# Altium project T3-COM1-2.PrjPcb (part 2 of 6)
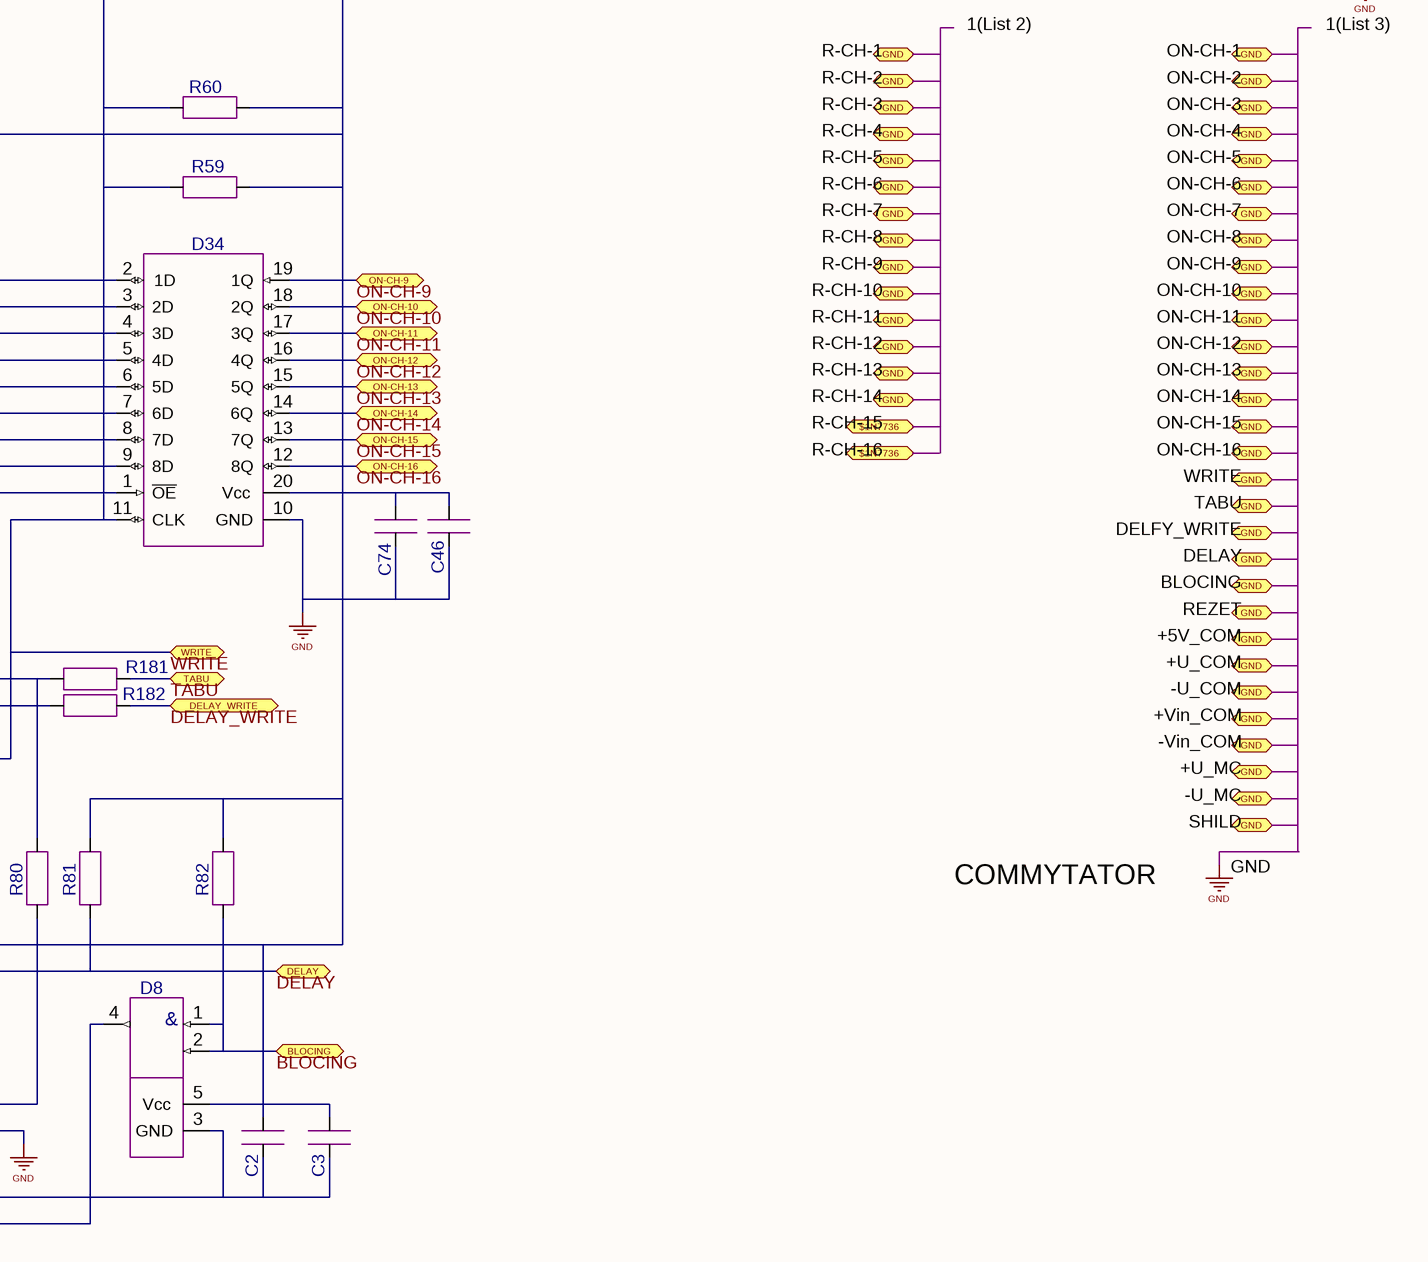
[diagram p16: Schematic1_1.SchDoc, bottom right]

## Sheet Schematic1_1.SchDoc (continued)

### Library data of the parts
C1 = CAP CER 0.1UF 50V 10% X7R 0603: CL10B104KB8SFNC; Part Label: 100nF VIP; Cell Name: 0603-STANDART-1608; CmpIndex: 1222; Ref Designator: C1; Symbol name: C-SXEM-1.1; SymIndex: 6; Part Name: CAP CER 0.1UF 50V 10% X7R 0603; Part Number: CL10B104KB8SFNC
C2 = CAP CER 0.1UF 50V 10% X7R 0603: CL10B104KB8SFNC; Part Label: 100nF VIP; Cell Name: 0603-STANDART-1608; CmpIndex: 1233; Ref Designator: C2; Symbol name: C-SXEM-1.1; SymIndex: 6; Part Name: CAP CER 0.1UF 50V 10% X7R 0603; Part Number: CL10B104KB8SFNC
C3 = CAP CER 0.1UF 50V 10% X7R 0603: CL10B104KB8SFNC; Part Label: 100nF VIP; Cell Name: 0603-STANDART-1608; CmpIndex: 1234; Ref Designator: C3; Symbol name: C-SXEM-1.1; SymIndex: 6; Part Name: CAP CER 0.1UF 50V 10% X7R 0603; Part Number: CL10B104KB8SFNC
C4 = CAP CER 0.1UF 50V 10% X7R 0603: CL10B104KB8SFNC; Part Label: 100nF VIP; Cell Name: 0603-STANDART-1608; CmpIndex: 1235; Ref Designator: C4; Symbol name: C-SXEM-1.1; SymIndex: 6; Part Name: CAP CER 0.1UF 50V 10% X7R 0603; Part Number: CL10B104KB8SFNC
C5 = CAP CER 0.1UF 50V 10% X7R 0603: CL10B104KB8SFNC; Part Label: 100nF VIP; Cell Name: 0603-STANDART-1608; CmpIndex: 1236; Ref Designator: C5; Symbol name: C-SXEM-1.1; SymIndex: 6; Part Name: CAP CER 0.1UF 50V 10% X7R 0603; Part Number: CL10B104KB8SFNC
C6 = CAP CER 0.1UF 50V 10% X7R 0603: CL10B104KB8SFNC; Part Label: 100nF VIP; Cell Name: 0603-STANDART-1608; CmpIndex: 1237; Ref Designator: C6; Symbol name: C-SXEM-1.1; SymIndex: 6; Part Name: CAP CER 0.1UF 50V 10% X7R 0603; Part Number: CL10B104KB8SFNC
C7 = CAP CER 0.1UF 50V 10% X7R 0603: CL10B104KB8SFNC; Part Label: 100nF VIP; Cell Name: 0603-STANDART-1608; CmpIndex: 1238; Ref Designator: C7; Symbol name: C-SXEM-1.1; SymIndex: 6; Part Name: CAP CER 0.1UF 50V 10% X7R 0603; Part Number: CL10B104KB8SFNC
C45 = CAP CER 2.2UF 16V 10% X7R 0805: CL21B225KOFNNNE; Part Label: 2,2u VIP; Cell Name: 0805-STANDART-2012; CmpIndex: 784; Ref Designator: C45; Symbol name: C-SXEM-1.1; SymIndex: 6; Part Name: CAP CER 2.2UF 16V 10% X7R 0805; Part Number: CL21B225KOFNNNE
C46 = CAP CER 2.2UF 16V 10% X7R 0805: CL21B225KOFNNNE; Part Label: 2,2u VIP; Cell Name: 0805-STANDART-2012; CmpIndex: 1175; Ref Designator: C46; Symbol name: C-SXEM-1.1; SymIndex: 6; Part Name: CAP CER 2.2UF 16V 10% X7R 0805; Part Number: CL21B225KOFNNNE
C47 = CAP CER 2.2UF 16V 10% X7R 0805: CL21B225KOFNNNE; Part Label: 2,2u VIP; Cell Name: 0805-STANDART-2012; CmpIndex: 434; Ref Designator: C47; Symbol name: C-SXEM-1.1; SymIndex: 6; Part Name: CAP CER 2.2UF 16V 10% X7R 0805; Part Number: CL21B225KOFNNNE
C48 = CAP CER 2.2UF 16V 10% X7R 0805: CL21B225KOFNNNE; Part Label: 2,2u VIP; Cell Name: 0805-STANDART-2012; CmpIndex: 441; Ref Designator: C48; Symbol name: C-SXEM-1.1; SymIndex: 6; Part Name: CAP CER 2.2UF 16V 10% X7R 0805; Part Number: CL21B225KOFNNNE
C72 = CAP CER 10UF 16V 10% X7R 0805: CL21B106KOQNNNE; Part Label: 10uF VIP; Cell Name: 0805-STANDART-2012; CmpIndex: 1223; Ref Designator: C72; Symbol name: C-SXEM-1.1; SymIndex: 6; Part Name: CAP CER 10UF 16V 10% X7R 0805; Part Number: CL21B106KOQNNNE
C73 = CAP CER 10UF 16V 10% X7R 0805: CL21B106KOQNNNE; Part Label: 10uF VIP; Cell Name: 0805-STANDART-2012; CmpIndex: 356; Ref Designator: C73; Symbol name: C-SXEM-1.1; SymIndex: 6; Part Name: CAP CER 10UF 16V 10% X7R 0805; Part Number: CL21B106KOQNNNE
C74 = CAP CER 10UF 16V 10% X7R 0805: CL21B106KOQNNNE; Part Label: 10uF VIP; Cell Name: 0805-STANDART-2012; CmpIndex: 357; Ref Designator: C74; Symbol name: C-SXEM-1.1; SymIndex: 6; Part Name: CAP CER 10UF 16V 10% X7R 0805; Part Number: CL21B106KOQNNNE
C95 = CAP CER 10UF 25V 10% X7R 1210: GRM32DR71E106KA12L; Cell Name: 1210-STANDART-3225; CmpIndex: 1209; Ref Designator: C95; Symbol name: C-SXEM-1.1; SymIndex: 6; Part Label: 10uF; Part Name: CAP CER 10UF 25V 10% X7R 1210; Part Number: GRM32DR71E106KA12L
C96 = CAP CER 10UF 25V 10% X7R 1210: GRM32DR71E106KA12L; Cell Name: 1210-STANDART-3225; CmpIndex: 1210; Ref Designator: C96; Symbol name: C-SXEM-1.1; SymIndex: 6; Part Label: 10uF; Part Name: CAP CER 10UF 25V 10% X7R 1210; Part Number: GRM32DR71E106KA12L
C97 = CAP CER 10UF 25V 10% X7R 1210: GRM32DR71E106KA12L; Cell Name: 1210-STANDART-3225; CmpIndex: 1211; Ref Designator: C97; Symbol name: C-SXEM-1.1; SymIndex: 6; Part Label: 10uF; Part Name: CAP CER 10UF 25V 10% X7R 1210; Part Number: GRM32DR71E106KA12L
C117 = CAP CER 1000PF 50V 5% NP0 0603: GRM1885C1H102JA01D; Part Label: 1nF; Cell Name: 0603-STANDART-1608; CmpIndex: 649; Ref Designator: C117; Symbol name: C-SXEM-1.1; SymIndex: 6; Part Name: CAP CER 1000PF 50V 5% NP0 0603; Part Number: GRM1885C1H102JA01D
C118 = CAP CER 1000PF 50V 5% NP0 0603: GRM1885C1H102JA01D; Part Label: 1nF; Cell Name: 0603-STANDART-1608; CmpIndex: 661; Ref Designator: C118; Symbol name: C-SXEM-1.1; SymIndex: 6; Part Name: CAP CER 1000PF 50V 5% NP0 0603; Part Number: GRM1885C1H102JA01D
C119 = CAP CER 1000PF 50V 5% NP0 0603: GRM1885C1H102JA01D; Part Label: 1nF; Cell Name: 0603-STANDART-1608; CmpIndex: 664; Ref Designator: C119; Symbol name: C-SXEM-1.1; SymIndex: 6; Part Name: CAP CER 1000PF 50V 5% NP0 0603; Part Number: GRM1885C1H102JA01D
C120 = CAP CER 1000PF 50V 5% NP0 0603: GRM1885C1H102JA01D; Part Label: 1nF; Cell Name: 0603-STANDART-1608; CmpIndex: 666; Ref Designator: C120; Symbol name: C-SXEM-1.1; SymIndex: 6; Part Name: CAP CER 1000PF 50V 5% NP0 0603; Part Number: GRM1885C1H102JA01D
C121 = CAP CER 1000PF 50V 5% NP0 0603: GRM1885C1H102JA01D; Part Label: 1nF; Cell Name: 0603-STANDART-1608; CmpIndex: 670; Ref Designator: C121; Symbol name: C-SXEM-1.1; SymIndex: 6; Part Name: CAP CER 1000PF 50V 5% NP0 0603; Part Number: GRM1885C1H102JA01D
C122 = CAP CER 1000PF 50V 5% NP0 0603: GRM1885C1H102JA01D; Part Label: 1nF; Cell Name: 0603-STANDART-1608; CmpIndex: 682; Ref Designator: C122; Symbol name: C-SXEM-1.1; SymIndex: 6; Part Name: CAP CER 1000PF 50V 5% NP0 0603; Part Number: GRM1885C1H102JA01D
C123 = CAP CER 1000PF 50V 5% NP0 0603: GRM1885C1H102JA01D; Part Label: 1nF; Cell Name: 0603-STANDART-1608; CmpIndex: 684; Ref Designator: C123; Symbol name: C-SXEM-1.1; SymIndex: 6; Part Name: CAP CER 1000PF 50V 5% NP0 0603; Part Number: GRM1885C1H102JA01D
C124 = CAP CER 1000PF 50V 5% NP0 0603: GRM1885C1H102JA01D; Part Label: 1nF; Cell Name: 0603-STANDART-1608; CmpIndex: 685; Ref Designator: C124; Symbol name: C-SXEM-1.1; SymIndex: 6; Part Name: CAP CER 1000PF 50V 5% NP0 0603; Part Number: GRM1885C1H102JA01D
C125 = CAP CER 1000PF 50V 5% NP0 0603: GRM1885C1H102JA01D; Part Label: 1nF; Cell Name: 0603-STANDART-1608; CmpIndex: 688; Ref Designator: C125; Symbol name: C-SXEM-1.1; SymIndex: 6; Part Name: CAP CER 1000PF 50V 5% NP0 0603; Part Number: GRM1885C1H102JA01D
C126 = CAP CER 1000PF 50V 5% NP0 0603: GRM1885C1H102JA01D; Part Label: 1nF; Cell Name: 0603-STANDART-1608; CmpIndex: 694; Ref Designator: C126; Symbol name: C-SXEM-1.1; SymIndex: 6; Part Name: CAP CER 1000PF 50V 5% NP0 0603; Part Number: GRM1885C1H102JA01D
C127 = CAP CER 1000PF 50V 5% NP0 0603: GRM1885C1H102JA01D; Part Label: 1nF; Cell Name: 0603-STANDART-1608; CmpIndex: 695; Ref Designator: C127; Symbol name: C-SXEM-1.1; SymIndex: 6; Part Name: CAP CER 1000PF 50V 5% NP0 0603; Part Number: GRM1885C1H102JA01D
C128 = CAP CER 1000PF 50V 5% NP0 0603: GRM1885C1H102JA01D; Part Label: 1nF; Cell Name: 0603-STANDART-1608; CmpIndex: 696; Ref Designator: C128; Symbol name: C-SXEM-1.1; SymIndex: 6; Part Name: CAP CER 1000PF 50V 5% NP0 0603; Part Number: GRM1885C1H102JA01D
C129 = CAP CER 1000PF 50V 5% NP0 0603: GRM1885C1H102JA01D; Part Label: 1nF; Cell Name: 0603-STANDART-1608; CmpIndex: 698; Ref Designator: C129; Symbol name: C-SXEM-1.1; SymIndex: 6; Part Name: CAP CER 1000PF 50V 5% NP0 0603; Part Number: GRM1885C1H102JA01D
C130 = CAP CER 1000PF 50V 5% NP0 0603: GRM1885C1H102JA01D; Part Label: 1nF; Cell Name: 0603-STANDART-1608; CmpIndex: 704; Ref Designator: C130; Symbol name: C-SXEM-1.1; SymIndex: 6; Part Name: CAP CER 1000PF 50V 5% NP0 0603; Part Number: GRM1885C1H102JA01D
C131 = CAP CER 1000PF 50V 5% NP0 0603: GRM1885C1H102JA01D; Part Label: 1nF; Cell Name: 0603-STANDART-1608; CmpIndex: 705; Ref Designator: C131; Symbol name: C-SXEM-1.1; SymIndex: 6; Part Name: CAP CER 1000PF 50V 5% NP0 0603; Part Number: GRM1885C1H102JA01D
C132 = CAP CER 1000PF 50V 5% NP0 0603: GRM1885C1H102JA01D; Part Label: 1nF; Cell Name: 0603-STANDART-1608; CmpIndex: 706; Ref Designator: C132; Symbol name: C-SXEM-1.1; SymIndex: 6; Part Name: CAP CER 1000PF 50V 5% NP0 0603; Part Number: GRM1885C1H102JA01D
C133 = CAP CER 1000PF 50V 5% NP0 0603: GRM1885C1H102JA01D; Part Label: 1nF; Cell Name: 0603-STANDART-1608; CmpIndex: 707; Ref Designator: C133; Symbol name: C-SXEM-1.1; SymIndex: 6; Part Name: CAP CER 1000PF 50V 5% NP0 0603; Part Number: GRM1885C1H102JA01D
C134 = CAP CER 1000PF 50V 5% NP0 0603: GRM1885C1H102JA01D; Part Label: 1nF; Cell Name: 0603-STANDART-1608; CmpIndex: 716; Ref Designator: C134; Symbol name: C-SXEM-1.1; SymIndex: 6; Part Name: CAP CER 1000PF 50V 5% NP0 0603; Part Number: GRM1885C1H102JA01D
D7 = IC GATE AND 1CH 2-INP SOT-23-5: SN74LVC1G08DBVR; Part Label: 5V/32mA; Cell Name: SOT-23-DBV-R-PDSO-G5-TI; CmpIndex: 1214; Ref Designator: D7; Symbol name: 1IN_AND_GATE.1; SymIndex: 60; Part Name: IC GATE AND 1CH 2-INP SOT-23-5; Part Number: SN74LVC1G08DBVR
D8 = IC GATE AND 1CH 2-INP SOT-23-5: SN74LVC1G08DBVR; Part Label: 5V/32mA; Cell Name: SOT-23-DBV-R-PDSO-G5-TI; CmpIndex: 1227; Ref Designator: D8; Symbol name: 1IN_AND_GATE.1; SymIndex: 60; Part Name: IC GATE AND 1CH 2-INP SOT-23-5; Part Number: SN74LVC1G08DBVR
D18 = OPTOISO 2.5KV 2CH TRANS 8SOIC: MOCD207R2M; Part Label: 2K; Cell Name: 8-SOIC-VISHAY; CmpIndex: 407; Ref Designator: D18; Symbol name: PS2501L-2.1; SymIndex: 24; Part Name: OPTOISO 2.5KV 2CH TRANS 8SOIC; Part Number: MOCD207R2M
D25 = IC DARL TRANS ARRAY 16-SOIC: ULN2003ADR; Part Label: 7K; Cell Name: D_R_PDSO-G16; CmpIndex: 406; Ref Designator: D25; Symbol name: ULN2003.1; SymIndex: 23; Part Name: IC DARL TRANS ARRAY 16-SOIC; Part Number: ULN2003ADR
D26 = IC DARL TRANS ARRAY 16-SOIC: ULN2003ADR; Part Label: 7K; Cell Name: D_R_PDSO-G16; CmpIndex: 622; Ref Designator: D26; Symbol name: ULN2003.1; SymIndex: 23; Part Name: IC DARL TRANS ARRAY 16-SOIC; Part Number: ULN2003ADR
D27 = IC DARL TRANS ARRAY 16-SOIC: ULN2003ADR; Part Label: 7K; Cell Name: D_R_PDSO-G16; CmpIndex: 636; Ref Designator: D27; Symbol name: ULN2003.1; SymIndex: 23; Part Name: IC DARL TRANS ARRAY 16-SOIC; Part Number: ULN2003ADR
D29 = OPTOISO 3KV 4CH TRANS 16SOIC: ACPL-247-500E; Part Label: 4K; Cell Name: 16-SOIC-VISHAY; CmpIndex: 648; Ref Designator: D29; Symbol name: PS2501L-4.1; SymIndex: 26; Part Name: OPTOISO 3KV 4CH TRANS 16SOIC; Part Number: ACPL-247-500E
D30 = OPTOISO 3KV 4CH TRANS 16SOIC: ACPL-247-500E; Part Label: 4K; Cell Name: 16-SOIC-VISHAY; CmpIndex: 667; Ref Designator: D30; Symbol name: PS2501L-4.1; SymIndex: 26; Part Name: OPTOISO 3KV 4CH TRANS 16SOIC; Part Number: ACPL-247-500E
D31 = OPTOISO 3KV 4CH TRANS 16SOIC: ACPL-247-500E; Part Label: 4K; Cell Name: 16-SOIC-VISHAY; CmpIndex: 687; Ref Designator: D31; Symbol name: PS2501L-4.1; SymIndex: 26; Part Name: OPTOISO 3KV 4CH TRANS 16SOIC; Part Number: ACPL-247-500E
D32 = OPTOISO 3KV 4CH TRANS 16SOIC: ACPL-247-500E; Part Label: 4K; Cell Name: 16-SOIC-VISHAY; CmpIndex: 697; Ref Designator: D32; Symbol name: PS2501L-4.1; SymIndex: 26; Part Name: OPTOISO 3KV 4CH TRANS 16SOIC; Part Number: ACPL-247-500E
D33 = IC D-TYPE POS TRG SNGL 20TSSOP: SN74AHC574PWR; Part Label: 4,4mm_NON-INV; Cell Name: PW-R-PDSO-G20-TI; CmpIndex: 774; Ref Designator: D33; Symbol name: SN74LVC574.1; SymIndex: 32; Part Name: IC D-TYPE POS TRG SNGL 20TSSOP; Part Number: SN74AHC574PWR
D34 = IC D-TYPE POS TRG SNGL 20TSSOP: SN74AHC574PWR; Part Label: 4,4mm_NON-INV; Cell Name: PW-R-PDSO-G20-TI; CmpIndex: 1070; Ref Designator: D34; Symbol name: SN74LVC574.1; SymIndex: 32; Part Name: IC D-TYPE POS TRG SNGL 20TSSOP; Part Number: SN74AHC574PWR
D40 = IC BUS TRANSCEIVER DUAL 20TSSOP: SN74ABT640PWR; Part Label: INV; Cell Name: PW-R-PDSO-G20; CmpIndex: 1277; Ref Designator: D40; Symbol name: SN74HCT245.1; SymIndex: 29; Part Name: IC BUS TRANSCEIVER DUAL 20TSSOP; Part Number: SN74ABT640PWR
D41 = IC BUS TRANSCEIVER DUAL 20TSSOP: SN74ABT640PWR; Part Label: INV; Cell Name: PW-R-PDSO-G20; CmpIndex: 1278; Ref Designator: D41; Symbol name: SN74HCT245.1; SymIndex: 29; Part Name: IC BUS TRANSCEIVER DUAL 20TSSOP; Part Number: SN74ABT640PWR
D42 = IC GATE NOR 1CH 3-INP SOT-23-6: SN74LVC1G27DBVR; Cell Name: DBV_R-PDSO-G6; CmpIndex: 1286; Ref Designator: D42; Symbol name: 3IN_NOR_GATE.1; SymIndex: 70; Part Name: IC GATE NOR 1CH 3-INP SOT-23-6; Part Number: SN74LVC1G27DBVR
D43 = IC ISOLATOR 2CH 3.75KV 8SOIC: SI8620EC-B-IS; Part Label: 2K; Cell Name: SOIC-8-SIL-LAB-NB; CmpIndex: 1338; Ref Designator: D43; Symbol name: SI8620.1; SymIndex: 73; Part Name: IC ISOLATOR 2CH 3.75KV 8SOIC; Part Number: SI8620EC-B-IS
FB1 = FERRITE BEAD 1000 OHM 0,4 A 0603: MMZ1608S102A; Part Label: 1K/0,4A; Cell Name: 0603-STANDART-1608; CmpIndex: 1276; Ref Designator: FB1; Symbol name: FERRITE-1.1; SymIndex: 10; Part Name: FERRITE BEAD 1000 OHM 0,4 A 0603; Part Number: MMZ1608S102A
FB8 = FERRITE BEAD 1800 OHM 0,2 A 0603: MMZ1608A182B; Part Label: 1,8K/0,2A; Cell Name: 0603-STANDART-1608; CmpIndex: 785; Ref Designator: FB8; Symbol name: FERRITE-1.1; SymIndex: 10; Part Name: FERRITE BEAD 1800 OHM 0,2 A 0603; Part Number: MMZ1608A182B
FB9 = FERRITE BEAD 1800 OHM 0,2 A 0603: MMZ1608A182B; Part Label: 1,8K/0,2A; Cell Name: 0603-STANDART-1608; CmpIndex: 1225; Ref Designator: FB9; Symbol name: FERRITE-1.1; SymIndex: 10; Part Name: FERRITE BEAD 1800 OHM 0,2 A 0603; Part Number: MMZ1608A182B
J1 = CONN JUMPER SHORTING .100" GOLD: SPC02SVJN-RC-3POS; Part Label: 2 POS; Cell Name: PLS-3-2,54; CmpIndex: 775; Ref Designator: J1; Symbol name: JUMPER-3.1; SymIndex: 33; Part Name: CONN JUMPER SHORTING .100" GOLD; Part Number: SPC02SVJN-RC-3POS
J2 = CONN JUMPER SHORTING .100" GOLD: SPC02SVJN-RC-3POS; Part Label: 2 POS; Cell Name: PLS-3-2,54; CmpIndex: 776; Ref Designator: J2; Symbol name: JUMPER-3.1; SymIndex: 33; Part Name: CONN JUMPER SHORTING .100" GOLD; Part Number: SPC02SVJN-RC-3POS
J3 = CONN JUMPER SHORTING .100" GOLD: SPC02SVJN-RC-3POS; Part Label: 2 POS; Cell Name: PLS-3-2,54; CmpIndex: 777; Ref Designator: J3; Symbol name: JUMPER-3.1; SymIndex: 33; Part Name: CONN JUMPER SHORTING .100" GOLD; Part Number: SPC02SVJN-RC-3POS
J4 = CONN JUMPER SHORTING .100" GOLD: SPC02SVJN-RC-3POS; Part Label: 2 POS; Cell Name: PLS-3-2,54; CmpIndex: 778; Ref Designator: J4; Symbol name: JUMPER-3.1; SymIndex: 33; Part Name: CONN JUMPER SHORTING .100" GOLD; Part Number: SPC02SVJN-RC-3POS
J5 = CONN JUMPER SHORTING .100" GOLD: SPC02SVJN-RC-3POS; Part Label: 2 POS; Cell Name: PLS-3-2,54; CmpIndex: 779; Ref Designator: J5; Symbol name: JUMPER-3.1; SymIndex: 33; Part Name: CONN JUMPER SHORTING .100" GOLD; Part Number: SPC02SVJN-RC-3POS
J6 = CONN JUMPER SHORTING .100" GOLD: SPC02SVJN-RC-3POS; Part Label: 2 POS; Cell Name: PLS-3-2,54; CmpIndex: 780; Ref Designator: J6; Symbol name: JUMPER-3.1; SymIndex: 33; Part Name: CONN JUMPER SHORTING .100" GOLD; Part Number: SPC02SVJN-RC-3POS
J7 = CONN JUMPER SHORTING .100" GOLD: SPC02SVJN-RC-3POS; Part Label: 2 POS; Cell Name: PLS-3-2,54; CmpIndex: 781; Ref Designator: J7; Symbol name: JUMPER-3.1; SymIndex: 33; Part Name: CONN JUMPER SHORTING .100" GOLD; Part Number: SPC02SVJN-RC-3POS
J8 = CONN JUMPER SHORTING .100" GOLD: SPC02SVJN-RC-3POS; Part Label: 2 POS; Cell Name: PLS-3-2,54; CmpIndex: 782; Ref Designator: J8; Symbol name: JUMPER-3.1; SymIndex: 33; Part Name: CONN JUMPER SHORTING .100" GOLD; Part Number: SPC02SVJN-RC-3POS
J9 = CONN JUMPER SHORTING .100" GOLD: SPC02SVJN-RC-3POS; Part Label: 2 POS; Cell Name: PLS-3-2,54; CmpIndex: 1071; Ref Designator: J9; Symbol name: JUMPER-3.1; SymIndex: 33; Part Name: CONN JUMPER SHORTING .100" GOLD; Part Number: SPC02SVJN-RC-3POS
J10 = CONN JUMPER SHORTING .100" GOLD: SPC02SVJN-RC-3POS; Part Label: 2 POS; Cell Name: PLS-3-2,54; CmpIndex: 1166; Ref Designator: J10; Symbol name: JUMPER-3.1; SymIndex: 33; Part Name: CONN JUMPER SHORTING .100" GOLD; Part Number: SPC02SVJN-RC-3POS
J11 = CONN JUMPER SHORTING .100" GOLD: SPC02SVJN-RC-3POS; Part Label: 2 POS; Cell Name: PLS-3-2,54; CmpIndex: 1168; Ref Designator: J11; Symbol name: JUMPER-3.1; SymIndex: 33; Part Name: CONN JUMPER SHORTING .100" GOLD; Part Number: SPC02SVJN-RC-3POS
J12 = CONN JUMPER SHORTING .100" GOLD: SPC02SVJN-RC-3POS; Part Label: 2 POS; Cell Name: PLS-3-2,54; CmpIndex: 1169; Ref Designator: J12; Symbol name: JUMPER-3.1; SymIndex: 33; Part Name: CONN JUMPER SHORTING .100" GOLD; Part Number: SPC02SVJN-RC-3POS
J13 = CONN JUMPER SHORTING .100" GOLD: SPC02SVJN-RC-3POS; Part Label: 2 POS; Cell Name: PLS-3-2,54; CmpIndex: 1170; Ref Designator: J13; Symbol name: JUMPER-3.1; SymIndex: 33; Part Name: CONN JUMPER SHORTING .100" GOLD; Part Number: SPC02SVJN-RC-3POS
J14 = CONN JUMPER SHORTING .100" GOLD: SPC02SVJN-RC-3POS; Part Label: 2 POS; Cell Name: PLS-3-2,54; CmpIndex: 1171; Ref Designator: J14; Symbol name: JUMPER-3.1; SymIndex: 33; Part Name: CONN JUMPER SHORTING .100" GOLD; Part Number: SPC02SVJN-RC-3POS
J15 = CONN JUMPER SHORTING .100" GOLD: SPC02SVJN-RC-3POS; Part Label: 2 POS; Cell Name: PLS-3-2,54; CmpIndex: 1172; Ref Designator: J15; Symbol name: JUMPER-3.1; SymIndex: 33; Part Name: CONN JUMPER SHORTING .100" GOLD; Part Number: SPC02SVJN-RC-3POS
J16 = CONN JUMPER SHORTING .100" GOLD: SPC02SVJN-RC-3POS; Part Label: 2 POS; Cell Name: PLS-3-2,54; CmpIndex: 1173; Ref Designator: J16; Symbol name: JUMPER-3.1; SymIndex: 33; Part Name: CONN JUMPER SHORTING .100" GOLD; Part Number: SPC02SVJN-RC-3POS
KW1 = MGSHV-0_12-D1_3xd0.45: CmpIndex: 460; Ref Designator: KW1; Symbol name: KONT-PROVOD.1; SymIndex: 77; Part Name: MGSHV-0_12-D1_3xd0.45; Part Number: MGSHV-0_12-D1_3xd0.45
KW2 = MGSHV-0_12-D1_3xd0.45: CmpIndex: 461; Ref Designator: KW2; Symbol name: KONT-PROVOD.1; SymIndex: 77; Part Name: MGSHV-0_12-D1_3xd0.45; Part Number: MGSHV-0_12-D1_3xd0.45
KW3 = MGSHV-0_12-D1_3xd0.45: CmpIndex: 462; Ref Designator: KW3; Symbol name: KONT-PROVOD.1; SymIndex: 77; Part Name: MGSHV-0_12-D1_3xd0.45; Part Number: MGSHV-0_12-D1_3xd0.45
R41 = RES 4.70K OHM 1/10W 1% 0603 SMD: ERJ-3EKF4701V; Part Label: 4,7K; Cell Name: 0603-STANDART-1608; CmpIndex: 717; Ref Designator: R41; Symbol name: R-SXEM-1.1; SymIndex: 1; Part Name: RES 4.70K OHM 1/10W 1% 0603 SMD; Part Number: ERJ-3EKF4701V
R42 = RES 4.70K OHM 1/10W 1% 0603 SMD: ERJ-3EKF4701V; Part Label: 4,7K; Cell Name: 0603-STANDART-1608; CmpIndex: 720; Ref Designator: R42; Symbol name: R-SXEM-1.1; SymIndex: 1; Part Name: RES 4.70K OHM 1/10W 1% 0603 SMD; Part Number: ERJ-3EKF4701V
R43 = RES 4.70K OHM 1/10W 1% 0603 SMD: ERJ-3EKF4701V; Part Label: 4,7K; Cell Name: 0603-STANDART-1608; CmpIndex: 721; Ref Designator: R43; Symbol name: R-SXEM-1.1; SymIndex: 1; Part Name: RES 4.70K OHM 1/10W 1% 0603 SMD; Part Number: ERJ-3EKF4701V
R44 = RES 4.70K OHM 1/10W 1% 0603 SMD: ERJ-3EKF4701V; Part Label: 4,7K; Cell Name: 0603-STANDART-1608; CmpIndex: 722; Ref Designator: R44; Symbol name: R-SXEM-1.1; SymIndex: 1; Part Name: RES 4.70K OHM 1/10W 1% 0603 SMD; Part Number: ERJ-3EKF4701V
R45 = RES 4.70K OHM 1/10W 1% 0603 SMD: ERJ-3EKF4701V; Part Label: 4,7K; Cell Name: 0603-STANDART-1608; CmpIndex: 725; Ref Designator: R45; Symbol name: R-SXEM-1.1; SymIndex: 1; Part Name: RES 4.70K OHM 1/10W 1% 0603 SMD; Part Number: ERJ-3EKF4701V
R46 = RES 4.70K OHM 1/10W 1% 0603 SMD: ERJ-3EKF4701V; Part Label: 4,7K; Cell Name: 0603-STANDART-1608; CmpIndex: 726; Ref Designator: R46; Symbol name: R-SXEM-1.1; SymIndex: 1; Part Name: RES 4.70K OHM 1/10W 1% 0603 SMD; Part Number: ERJ-3EKF4701V
R47 = RES 4.70K OHM 1/10W 1% 0603 SMD: ERJ-3EKF4701V; Part Label: 4,7K; Cell Name: 0603-STANDART-1608; CmpIndex: 727; Ref Designator: R47; Symbol name: R-SXEM-1.1; SymIndex: 1; Part Name: RES 4.70K OHM 1/10W 1% 0603 SMD; Part Number: ERJ-3EKF4701V
R48 = RES 4.70K OHM 1/10W 1% 0603 SMD: ERJ-3EKF4701V; Part Label: 4,7K; Cell Name: 0603-STANDART-1608; CmpIndex: 730; Ref Designator: R48; Symbol name: R-SXEM-1.1; SymIndex: 1; Part Name: RES 4.70K OHM 1/10W 1% 0603 SMD; Part Number: ERJ-3EKF4701V
R49 = RES 4.70K OHM 1/10W 1% 0603 SMD: ERJ-3EKF4701V; Part Label: 4,7K; Cell Name: 0603-STANDART-1608; CmpIndex: 747; Ref Designator: R49; Symbol name: R-SXEM-1.1; SymIndex: 1; Part Name: RES 4.70K OHM 1/10W 1% 0603 SMD; Part Number: ERJ-3EKF4701V
R50 = RES 4.70K OHM 1/10W 1% 0603 SMD: ERJ-3EKF4701V; Part Label: 4,7K; Cell Name: 0603-STANDART-1608; CmpIndex: 760; Ref Designator: R50; Symbol name: R-SXEM-1.1; SymIndex: 1; Part Name: RES 4.70K OHM 1/10W 1% 0603 SMD; Part Number: ERJ-3EKF4701V
R51 = RES 4.70K OHM 1/10W 1% 0603 SMD: ERJ-3EKF4701V; Part Label: 4,7K; Cell Name: 0603-STANDART-1608; CmpIndex: 786; Ref Designator: R51; Symbol name: R-SXEM-1.1; SymIndex: 1; Part Name: RES 4.70K OHM 1/10W 1% 0603 SMD; Part Number: ERJ-3EKF4701V
R52 = RES 4.70K OHM 1/10W 1% 0603 SMD: ERJ-3EKF4701V; Part Label: 4,7K; Cell Name: 0603-STANDART-1608; CmpIndex: 787; Ref Designator: R52; Symbol name: R-SXEM-1.1; SymIndex: 1; Part Name: RES 4.70K OHM 1/10W 1% 0603 SMD; Part Number: ERJ-3EKF4701V
R53 = RES 4.70K OHM 1/10W 1% 0603 SMD: ERJ-3EKF4701V; Part Label: 4,7K; Cell Name: 0603-STANDART-1608; CmpIndex: 788; Ref Designator: R53; Symbol name: R-SXEM-1.1; SymIndex: 1; Part Name: RES 4.70K OHM 1/10W 1% 0603 SMD; Part Number: ERJ-3EKF4701V
R54 = RES 4.70K OHM 1/10W 1% 0603 SMD: ERJ-3EKF4701V; Part Label: 4,7K; Cell Name: 0603-STANDART-1608; CmpIndex: 789; Ref Designator: R54; Symbol name: R-SXEM-1.1; SymIndex: 1; Part Name: RES 4.70K OHM 1/10W 1% 0603 SMD; Part Number: ERJ-3EKF4701V
R55 = RES 4.70K OHM 1/10W 1% 0603 SMD: ERJ-3EKF4701V; Part Label: 4,7K; Cell Name: 0603-STANDART-1608; CmpIndex: 790; Ref Designator: R55; Symbol name: R-SXEM-1.1; SymIndex: 1; Part Name: RES 4.70K OHM 1/10W 1% 0603 SMD; Part Number: ERJ-3EKF4701V
R56 = RES 4.70K OHM 1/10W 1% 0603 SMD: ERJ-3EKF4701V; Part Label: 4,7K; Cell Name: 0603-STANDART-1608; CmpIndex: 791; Ref Designator: R56; Symbol name: R-SXEM-1.1; SymIndex: 1; Part Name: RES 4.70K OHM 1/10W 1% 0603 SMD; Part Number: ERJ-3EKF4701V
R57 = RES 4.70K OHM 1/10W 1% 0603 SMD: ERJ-3EKF4701V; Part Label: 4,7K; Cell Name: 0603-STANDART-1608; CmpIndex: 792; Ref Designator: R57; Symbol name: R-SXEM-1.1; SymIndex: 1; Part Name: RES 4.70K OHM 1/10W 1% 0603 SMD; Part Number: ERJ-3EKF4701V
R58 = RES 4.70K OHM 1/10W 1% 0603 SMD: ERJ-3EKF4701V; Part Label: 4,7K; Cell Name: 0603-STANDART-1608; CmpIndex: 793; Ref Designator: R58; Symbol name: R-SXEM-1.1; SymIndex: 1; Part Name: RES 4.70K OHM 1/10W 1% 0603 SMD; Part Number: ERJ-3EKF4701V
R59 = RES 4.70K OHM 1/10W 1% 0603 SMD: ERJ-3EKF4701V; Part Label: 4,7K; Cell Name: 0603-STANDART-1608; CmpIndex: 1178; Ref Designator: R59; Symbol name: R-SXEM-1.1; SymIndex: 1; Part Name: RES 4.70K OHM 1/10W 1% 0603 SMD; Part Number: ERJ-3EKF4701V
R60 = RES 4.70K OHM 1/10W 1% 0603 SMD: ERJ-3EKF4701V; Part Label: 4,7K; Cell Name: 0603-STANDART-1608; CmpIndex: 1218; Ref Designator: R60; Symbol name: R-SXEM-1.1; SymIndex: 1; Part Name: RES 4.70K OHM 1/10W 1% 0603 SMD; Part Number: ERJ-3EKF4701V
R61 = RES 4.70K OHM 1/10W 1% 0603 SMD: ERJ-3EKF4701V; Part Label: 4,7K; Cell Name: 0603-STANDART-1608; CmpIndex: 1229; Ref Designator: R61; Symbol name: R-SXEM-1.1; SymIndex: 1; Part Name: RES 4.70K OHM 1/10W 1% 0603 SMD; Part Number: ERJ-3EKF4701V
R62 = RES 4.70K OHM 1/10W 1% 0603 SMD: ERJ-3EKF4701V; Part Label: 4,7K; Cell Name: 0603-STANDART-1608; CmpIndex: 1258; Ref Designator: R62; Symbol name: R-SXEM-1.1; SymIndex: 1; Part Name: RES 4.70K OHM 1/10W 1% 0603 SMD; Part Number: ERJ-3EKF4701V
R63 = RES 4.70K OHM 1/10W 1% 0603 SMD: ERJ-3EKF4701V; Part Label: 4,7K; Cell Name: 0603-STANDART-1608; CmpIndex: 1259; Ref Designator: R63; Symbol name: R-SXEM-1.1; SymIndex: 1; Part Name: RES 4.70K OHM 1/10W 1% 0603 SMD; Part Number: ERJ-3EKF4701V
R64 = RES 4.70K OHM 1/10W 1% 0603 SMD: ERJ-3EKF4701V; Part Label: 4,7K; Cell Name: 0603-STANDART-1608; CmpIndex: 1260; Ref Designator: R64; Symbol name: R-SXEM-1.1; SymIndex: 1; Part Name: RES 4.70K OHM 1/10W 1% 0603 SMD; Part Number: ERJ-3EKF4701V
R65 = RES 4.70K OHM 1/10W 1% 0603 SMD: ERJ-3EKF4701V; Part Label: 4,7K; Cell Name: 0603-STANDART-1608; CmpIndex: 1261; Ref Designator: R65; Symbol name: R-SXEM-1.1; SymIndex: 1; Part Name: RES 4.70K OHM 1/10W 1% 0603 SMD; Part Number: ERJ-3EKF4701V
R66 = RES 4.70K OHM 1/10W 1% 0603 SMD: ERJ-3EKF4701V; Part Label: 4,7K; Cell Name: 0603-STANDART-1608; CmpIndex: 1262; Ref Designator: R66; Symbol name: R-SXEM-1.1; SymIndex: 1; Part Name: RES 4.70K OHM 1/10W 1% 0603 SMD; Part Number: ERJ-3EKF4701V
R67 = RES 4.70K OHM 1/10W 1% 0603 SMD: ERJ-3EKF4701V; Part Label: 4,7K; Cell Name: 0603-STANDART-1608; CmpIndex: 1263; Ref Designator: R67; Symbol name: R-SXEM-1.1; SymIndex: 1; Part Name: RES 4.70K OHM 1/10W 1% 0603 SMD; Part Number: ERJ-3EKF4701V
R68 = RES 4.70K OHM 1/10W 1% 0603 SMD: ERJ-3EKF4701V; Part Label: 4,7K; Cell Name: 0603-STANDART-1608; CmpIndex: 1264; Ref Designator: R68; Symbol name: R-SXEM-1.1; SymIndex: 1; Part Name: RES 4.70K OHM 1/10W 1% 0603 SMD; Part Number: ERJ-3EKF4701V
R69 = RES 4.70K OHM 1/10W 1% 0603 SMD: ERJ-3EKF4701V; Part Label: 4,7K; Cell Name: 0603-STANDART-1608; CmpIndex: 1265; Ref Designator: R69; Symbol name: R-SXEM-1.1; SymIndex: 1; Part Name: RES 4.70K OHM 1/10W 1% 0603 SMD; Part Number: ERJ-3EKF4701V
R70 = RES 4.70K OHM 1/10W 1% 0603 SMD: ERJ-3EKF4701V; Part Label: 4,7K; Cell Name: 0603-STANDART-1608; CmpIndex: 1266; Ref Designator: R70; Symbol name: R-SXEM-1.1; SymIndex: 1; Part Name: RES 4.70K OHM 1/10W 1% 0603 SMD; Part Number: ERJ-3EKF4701V
R71 = RES 4.70K OHM 1/10W 1% 0603 SMD: ERJ-3EKF4701V; Part Label: 4,7K; Cell Name: 0603-STANDART-1608; CmpIndex: 1267; Ref Designator: R71; Symbol name: R-SXEM-1.1; SymIndex: 1; Part Name: RES 4.70K OHM 1/10W 1% 0603 SMD; Part Number: ERJ-3EKF4701V
R72 = RES 4.70K OHM 1/10W 1% 0603 SMD: ERJ-3EKF4701V; Part Label: 4,7K; Cell Name: 0603-STANDART-1608; CmpIndex: 1268; Ref Designator: R72; Symbol name: R-SXEM-1.1; SymIndex: 1; Part Name: RES 4.70K OHM 1/10W 1% 0603 SMD; Part Number: ERJ-3EKF4701V
R73 = RES 4.70K OHM 1/10W 1% 0603 SMD: ERJ-3EKF4701V; Part Label: 4,7K; Cell Name: 0603-STANDART-1608; CmpIndex: 1269; Ref Designator: R73; Symbol name: R-SXEM-1.1; SymIndex: 1; Part Name: RES 4.70K OHM 1/10W 1% 0603 SMD; Part Number: ERJ-3EKF4701V
R74 = RES 4.70K OHM 1/10W 1% 0603 SMD: ERJ-3EKF4701V; Part Label: 4,7K; Cell Name: 0603-STANDART-1608; CmpIndex: 1270; Ref Designator: R74; Symbol name: R-SXEM-1.1; SymIndex: 1; Part Name: RES 4.70K OHM 1/10W 1% 0603 SMD; Part Number: ERJ-3EKF4701V
R75 = RES 4.70K OHM 1/10W 1% 0603 SMD: ERJ-3EKF4701V; Part Label: 4,7K; Cell Name: 0603-STANDART-1608; CmpIndex: 1271; Ref Designator: R75; Symbol name: R-SXEM-1.1; SymIndex: 1; Part Name: RES 4.70K OHM 1/10W 1% 0603 SMD; Part Number: ERJ-3EKF4701V
R76 = RES 4.70K OHM 1/10W 1% 0603 SMD: ERJ-3EKF4701V; Part Label: 4,7K; Cell Name: 0603-STANDART-1608; CmpIndex: 1272; Ref Designator: R76; Symbol name: R-SXEM-1.1; SymIndex: 1; Part Name: RES 4.70K OHM 1/10W 1% 0603 SMD; Part Number: ERJ-3EKF4701V
R77 = RES 4.70K OHM 1/10W 1% 0603 SMD: ERJ-3EKF4701V; Part Label: 4,7K; Cell Name: 0603-STANDART-1608; CmpIndex: 1273; Ref Designator: R77; Symbol name: R-SXEM-1.1; SymIndex: 1; Part Name: RES 4.70K OHM 1/10W 1% 0603 SMD; Part Number: ERJ-3EKF4701V
R78 = RES 4.70K OHM 1/10W 1% 0603 SMD: ERJ-3EKF4701V; Part Label: 4,7K; Cell Name: 0603-STANDART-1608; CmpIndex: 1274; Ref Designator: R78; Symbol name: R-SXEM-1.1; SymIndex: 1; Part Name: RES 4.70K OHM 1/10W 1% 0603 SMD; Part Number: ERJ-3EKF4701V
R79 = RES 4.70K OHM 1/10W 1% 0603 SMD: ERJ-3EKF4701V; Part Label: 4,7K; Cell Name: 0603-STANDART-1608; CmpIndex: 1275; Ref Designator: R79; Symbol name: R-SXEM-1.1; SymIndex: 1; Part Name: RES 4.70K OHM 1/10W 1% 0603 SMD; Part Number: ERJ-3EKF4701V
R80 = RES 4.70K OHM 1/10W 1% 0603 SMD: ERJ-3EKF4701V; Part Label: 4,7K; Cell Name: 0603-STANDART-1608; CmpIndex: 1282; Ref Designator: R80; Symbol name: R-SXEM-1.1; SymIndex: 1; Part Name: RES 4.70K OHM 1/10W 1% 0603 SMD; Part Number: ERJ-3EKF4701V
R81 = RES 4.70K OHM 1/10W 1% 0603 SMD: ERJ-3EKF4701V; Part Label: 4,7K; Cell Name: 0603-STANDART-1608; CmpIndex: 1283; Ref Designator: R81; Symbol name: R-SXEM-1.1; SymIndex: 1; Part Name: RES 4.70K OHM 1/10W 1% 0603 SMD; Part Number: ERJ-3EKF4701V
R82 = RES 4.70K OHM 1/10W 1% 0603 SMD: ERJ-3EKF4701V; Part Label: 4,7K; Cell Name: 0603-STANDART-1608; CmpIndex: 1284; Ref Designator: R82; Symbol name: R-SXEM-1.1; SymIndex: 1; Part Name: RES 4.70K OHM 1/10W 1% 0603 SMD; Part Number: ERJ-3EKF4701V
R83 = RES 4.70K OHM 1/10W 1% 0603 SMD: ERJ-3EKF4701V; Part Label: 4,7K; Cell Name: 0603-STANDART-1608; CmpIndex: 1289; Ref Designator: R83; Symbol name: R-SXEM-1.1; SymIndex: 1; Part Name: RES 4.70K OHM 1/10W 1% 0603 SMD; Part Number: ERJ-3EKF4701V
R108 = RES 620 OHM 1/10W 1% 0603 SMD: ERJ-3EKF6200V; Part Label: 620R; Cell Name: 0603-STANDART-1608; CmpIndex: 1240; Ref Designator: R108; Symbol name: R-SXEM-1.1; SymIndex: 1; Part Name: RES 620 OHM 1/10W 1% 0603 SMD; Part Number: ERJ-3EKF6200V
R109 = RES 620 OHM 1/10W 1% 0603 SMD: ERJ-3EKF6200V; Part Label: 620R; Cell Name: 0603-STANDART-1608; CmpIndex: 1241; Ref Designator: R109; Symbol name: R-SXEM-1.1; SymIndex: 1; Part Name: RES 620 OHM 1/10W 1% 0603 SMD; Part Number: ERJ-3EKF6200V
R110 = RES 620 OHM 1/10W 1% 0603 SMD: ERJ-3EKF6200V; Part Label: 620R; Cell Name: 0603-STANDART-1608; CmpIndex: 1242; Ref Designator: R110; Symbol name: R-SXEM-1.1; SymIndex: 1; Part Name: RES 620 OHM 1/10W 1% 0603 SMD; Part Number: ERJ-3EKF6200V
R111 = RES 620 OHM 1/10W 1% 0603 SMD: ERJ-3EKF6200V; Part Label: 620R; Cell Name: 0603-STANDART-1608; CmpIndex: 1243; Ref Designator: R111; Symbol name: R-SXEM-1.1; SymIndex: 1; Part Name: RES 620 OHM 1/10W 1% 0603 SMD; Part Number: ERJ-3EKF6200V
R112 = RES 620 OHM 1/10W 1% 0603 SMD: ERJ-3EKF6200V; Part Label: 620R; Cell Name: 0603-STANDART-1608; CmpIndex: 1244; Ref Designator: R112; Symbol name: R-SXEM-1.1; SymIndex: 1; Part Name: RES 620 OHM 1/10W 1% 0603 SMD; Part Number: ERJ-3EKF6200V
R113 = RES 620 OHM 1/10W 1% 0603 SMD: ERJ-3EKF6200V; Part Label: 620R; Cell Name: 0603-STANDART-1608; CmpIndex: 1245; Ref Designator: R113; Symbol name: R-SXEM-1.1; SymIndex: 1; Part Name: RES 620 OHM 1/10W 1% 0603 SMD; Part Number: ERJ-3EKF6200V
R114 = RES 620 OHM 1/10W 1% 0603 SMD: ERJ-3EKF6200V; Part Label: 620R; Cell Name: 0603-STANDART-1608; CmpIndex: 1246; Ref Designator: R114; Symbol name: R-SXEM-1.1; SymIndex: 1; Part Name: RES 620 OHM 1/10W 1% 0603 SMD; Part Number: ERJ-3EKF6200V
R115 = RES 620 OHM 1/10W 1% 0603 SMD: ERJ-3EKF6200V; Part Label: 620R; Cell Name: 0603-STANDART-1608; CmpIndex: 1247; Ref Designator: R115; Symbol name: R-SXEM-1.1; SymIndex: 1; Part Name: RES 620 OHM 1/10W 1% 0603 SMD; Part Number: ERJ-3EKF6200V
R116 = RES 620 OHM 1/10W 1% 0603 SMD: ERJ-3EKF6200V; Part Label: 620R; Cell Name: 0603-STANDART-1608; CmpIndex: 1248; Ref Designator: R116; Symbol name: R-SXEM-1.1; SymIndex: 1; Part Name: RES 620 OHM 1/10W 1% 0603 SMD; Part Number: ERJ-3EKF6200V
R117 = RES 620 OHM 1/10W 1% 0603 SMD: ERJ-3EKF6200V; Part Label: 620R; Cell Name: 0603-STANDART-1608; CmpIndex: 1249; Ref Designator: R117; Symbol name: R-SXEM-1.1; SymIndex: 1; Part Name: RES 620 OHM 1/10W 1% 0603 SMD; Part Number: ERJ-3EKF6200V
R118 = RES 620 OHM 1/10W 1% 0603 SMD: ERJ-3EKF6200V; Part Label: 620R; Cell Name: 0603-STANDART-1608; CmpIndex: 1250; Ref Designator: R118; Symbol name: R-SXEM-1.1; SymIndex: 1; Part Name: RES 620 OHM 1/10W 1% 0603 SMD; Part Number: ERJ-3EKF6200V
R119 = RES 620 OHM 1/10W 1% 0603 SMD: ERJ-3EKF6200V; Part Label: 620R; Cell Name: 0603-STANDART-1608; CmpIndex: 1251; Ref Designator: R119; Symbol name: R-SXEM-1.1; SymIndex: 1; Part Name: RES 620 OHM 1/10W 1% 0603 SMD; Part Number: ERJ-3EKF6200V
R120 = RES 620 OHM 1/10W 1% 0603 SMD: ERJ-3EKF6200V; Part Label: 620R; Cell Name: 0603-STANDART-1608; CmpIndex: 1252; Ref Designator: R120; Symbol name: R-SXEM-1.1; SymIndex: 1; Part Name: RES 620 OHM 1/10W 1% 0603 SMD; Part Number: ERJ-3EKF6200V
R121 = RES 620 OHM 1/10W 1% 0603 SMD: ERJ-3EKF6200V; Part Label: 620R; Cell Name: 0603-STANDART-1608; CmpIndex: 1253; Ref Designator: R121; Symbol name: R-SXEM-1.1; SymIndex: 1; Part Name: RES 620 OHM 1/10W 1% 0603 SMD; Part Number: ERJ-3EKF6200V
R122 = RES 620 OHM 1/10W 1% 0603 SMD: ERJ-3EKF6200V; Part Label: 620R; Cell Name: 0603-STANDART-1608; CmpIndex: 1254; Ref Designator: R122; Symbol name: R-SXEM-1.1; SymIndex: 1; Part Name: RES 620 OHM 1/10W 1% 0603 SMD; Part Number: ERJ-3EKF6200V
R123 = RES 620 OHM 1/10W 1% 0603 SMD: ERJ-3EKF6200V; Part Label: 620R; Cell Name: 0603-STANDART-1608; CmpIndex: 1255; Ref Designator: R123; Symbol name: R-SXEM-1.1; SymIndex: 1; Part Name: RES 620 OHM 1/10W 1% 0603 SMD; Part Number: ERJ-3EKF6200V
R124 = RES 620 OHM 1/10W 1% 0603 SMD: ERJ-3EKF6200V; Part Label: 620R; Cell Name: 0603-STANDART-1608; CmpIndex: 1256; Ref Designator: R124; Symbol name: R-SXEM-1.1; SymIndex: 1; Part Name: RES 620 OHM 1/10W 1% 0603 SMD; Part Number: ERJ-3EKF6200V
R125 = RES 620 OHM 1/10W 1% 0603 SMD: ERJ-3EKF6200V; Part Label: 620R; Cell Name: 0603-STANDART-1608; CmpIndex: 1257; Ref Designator: R125; Symbol name: R-SXEM-1.1; SymIndex: 1; Part Name: RES 620 OHM 1/10W 1% 0603 SMD; Part Number: ERJ-3EKF6200V
R175 = RES 0.0 OHM 1/10W 0603 SMD: ERJ-3GEY0R00V; Part Label: 0R; Cell Name: 0603-STANDART-1608; CmpIndex: 408; Ref Designator: R175; Symbol name: R-SXEM-1.1; SymIndex: 1; Part Name: RES 0.0 OHM 1/10W 0603 SMD; Part Number: ERJ-3GEY0R00V
R176 = RES 0.0 OHM 1/10W 0603 SMD: ERJ-3GEY0R00V; Part Label: 0R; Cell Name: 0603-STANDART-1608; CmpIndex: 751; Ref Designator: R176; Symbol name: R-SXEM-1.1; SymIndex: 1; Part Name: RES 0.0 OHM 1/10W 0603 SMD; Part Number: ERJ-3GEY0R00V
R177 = RES 0.0 OHM 1/10W 0603 SMD: ERJ-3GEY0R00V; Part Label: 0R; Cell Name: 0603-STANDART-1608; CmpIndex: 761; Ref Designator: R177; Symbol name: R-SXEM-1.1; SymIndex: 1; Part Name: RES 0.0 OHM 1/10W 0603 SMD; Part Number: ERJ-3GEY0R00V
R178 = RES 0.0 OHM 1/10W 0603 SMD: ERJ-3GEY0R00V; Part Label: 0R; Cell Name: 0603-STANDART-1608; CmpIndex: 1219; Ref Designator: R178; Symbol name: R-SXEM-1.1; SymIndex: 1; Part Name: RES 0.0 OHM 1/10W 0603 SMD; Part Number: ERJ-3GEY0R00V
R179 = RES 0.0 OHM 1/10W 0603 SMD: ERJ-3GEY0R00V; Part Label: 0R; Cell Name: 0603-STANDART-1608; CmpIndex: 1279; Ref Designator: R179; Symbol name: R-SXEM-1.1; SymIndex: 1; Part Name: RES 0.0 OHM 1/10W 0603 SMD; Part Number: ERJ-3GEY0R00V
R180 = RES 0.0 OHM 1/10W 0603 SMD: ERJ-3GEY0R00V; Part Label: 0R; Cell Name: 0603-STANDART-1608; CmpIndex: 1280; Ref Designator: R180; Symbol name: R-SXEM-1.1; SymIndex: 1; Part Name: RES 0.0 OHM 1/10W 0603 SMD; Part Number: ERJ-3GEY0R00V
R181 = RES 0.0 OHM 1/10W 0603 SMD: ERJ-3GEY0R00V; Part Label: 0R; Cell Name: 0603-STANDART-1608; CmpIndex: 1285; Ref Designator: R181; Symbol name: R-SXEM-1.1; SymIndex: 1; Part Name: RES 0.0 OHM 1/10W 0603 SMD; Part Number: ERJ-3GEY0R00V
R182 = RES 0.0 OHM 1/10W 0603 SMD: ERJ-3GEY0R00V; Part Label: 0R; Cell Name: 0603-STANDART-1608; CmpIndex: 1288; Ref Designator: R182; Symbol name: R-SXEM-1.1; SymIndex: 1; Part Name: RES 0.0 OHM 1/10W 0603 SMD; Part Number: ERJ-3GEY0R00V
R183 = RES 0.0 OHM 1/10W 0603 SMD: ERJ-3GEY0R00V; Part Label: 0R; Cell Name: 0603-STANDART-1608; CmpIndex: 354; Ref Designator: R183; Symbol name: R-SXEM-1.1; SymIndex: 1; Part Name: RES 0.0 OHM 1/10W 0603 SMD; Part Number: ERJ-3GEY0R00V
R184 = RES 0.0 OHM 1/10W 0603 SMD: ERJ-3GEY0R00V; Part Label: 0R; Cell Name: 0603-STANDART-1608; CmpIndex: 355; Ref Designator: R184; Symbol name: R-SXEM-1.1; SymIndex: 1; Part Name: RES 0.0 OHM 1/10W 0603 SMD; Part Number: ERJ-3GEY0R00V
R242 = RES 10.0 OHM 1/10W 1% 0603 SMD: ERJ-3EKF10R0V; Part Label: 10R; Cell Name: 0603-STANDART-1608; CmpIndex: 1290; Ref Designator: R242; Symbol name: R-SXEM-1.1; SymIndex: 1; Part Name: RES 10.0 OHM 1/10W 1% 0603 SMD; Part Number: ERJ-3EKF10R0V
S1 = SWITCH TACTILE SPST-NO 0.1A 24V: 7914G-1-000E; Cell Name: 7914G; CmpIndex: 1215; Ref Designator: S1; Symbol name: 7914G.1; SymIndex: 61; Part Name: SWITCH TACTILE SPST-NO 0.1A 24V; Part Number: 7914G-1-000E
S2 = SWITCH TACTILE SPST-NO 0.1A 24V: 7914G-1-000E; Cell Name: 7914G; CmpIndex: 1216; Ref Designator: S2; Symbol name: 7914G.1; SymIndex: 61; Part Name: SWITCH TACTILE SPST-NO 0.1A 24V; Part Number: 7914G-1-000E
X21 = CONN HDR 2MM VERT W/SCREW 26POS: M80-5102642; Part Label: M80-26-VERT-J-TEK; Cell Name: M80-VERT-J-TEK-26; CmpIndex: 1182; Ref Designator: X21; Symbol name: M80-26.1; SymIndex: 36; Part Name: CONN HDR 2MM VERT W/SCREW 26POS; Part Number: M80-5102642